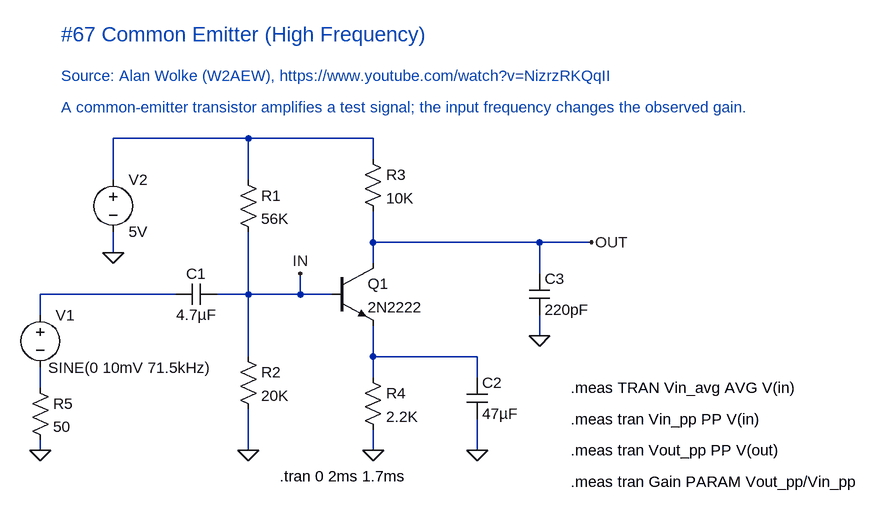
[diagram p0: schematic Common Emitter High Frequency).asc]
Common Emitter High Frequency).asc, the LTspice schematic file:
Version 4.1
SHEET 1 1400 680
WIRE 144 -144 -64 -144
WIRE 336 -144 144 -144
WIRE 336 -112 336 -144
WIRE -64 -80 -64 -144
WIRE 144 -80 144 -144
WIRE 336 16 336 -32
WIRE 592 16 336 16
WIRE 672 16 592 16
WIRE -64 32 -64 0
WIRE 336 48 336 16
WIRE 592 64 592 16
WIRE 32 96 -176 96
WIRE 144 96 144 0
WIRE 144 96 96 96
WIRE 224 96 224 64
WIRE 224 96 144 96
WIRE 272 96 224 96
WIRE -176 128 -176 96
WIRE 592 160 592 128
WIRE 144 192 144 96
WIRE 336 192 336 144
WIRE 496 192 336 192
WIRE 336 224 336 192
WIRE 496 224 496 192
WIRE -176 240 -176 208
WIRE -176 336 -176 320
WIRE 144 336 144 272
WIRE 336 336 336 304
WIRE 496 336 496 288
FLAG 144 336 0
FLAG 336 336 0
FLAG 496 336 0
FLAG 592 160 0
FLAG -64 32 0
FLAG 672 16 OUT
FLAG -176 336 0
FLAG 224 64 IN
SYMBOL cap 96 80 R90
WINDOW 0 0 32 VBottom 2
WINDOW 3 32 32 VTop 2
SYMATTR InstName C1
SYMATTR Value 4.7µF
SYMBOL res 128 -96 R0
SYMATTR InstName R1
SYMATTR Value 56K
SYMBOL res 128 176 R0
SYMATTR InstName R2
SYMATTR Value 20K
SYMBOL npn 272 48 R0
SYMATTR InstName Q1
SYMATTR Value 2N2222
SYMBOL res 320 -128 R0
SYMATTR InstName R3
SYMATTR Value 10K
SYMBOL res 320 208 R0
SYMATTR InstName R4
SYMATTR Value 2.2K
SYMBOL cap 480 224 R0
SYMATTR InstName C2
SYMATTR Value 47µF
SYMBOL cap 576 64 R0
SYMATTR InstName C3
SYMATTR Value 220pF
SYMBOL voltage -64 -96 R0
WINDOW 123 0 0 Left 0
WINDOW 39 0 0 Left 0
SYMATTR InstName V2
SYMATTR Value 5V
SYMBOL voltage -176 112 R0
WINDOW 3 12 97 Left 2
WINDOW 123 0 0 Left 0
WINDOW 39 0 0 Left 0
SYMATTR Value SINE(0 10mV 71.5kHz)
SYMATTR InstName V1
SYMBOL res -192 224 R0
SYMATTR InstName R5
SYMATTR Value 50
TEXT 192 376 Left 2 !.tran 0 2ms 1.7ms
TEXT 640 240 Left 2 !.meas TRAN Vin_avg AVG V(in)
TEXT 640 288 Left 2 !.meas tran Vin_pp PP V(in)
TEXT 640 336 Left 2 !.meas tran Vout_pp PP V(out)
TEXT 640 384 Left 2 !.meas tran Gain PARAM Vout_pp/Vin_pp
TEXT -144 -304 Left 3 ;#67 Common Emitter (High Frequency)
TEXT -144 -240 Left 2 ;Source: Alan Wolke (W2AEW), https://www.youtube.com/watch?v=NizrzRKQqII
TEXT -144 -192 Left 2 ;A common-emitter transistor amplifies a test signal; the input frequency changes the observed gain.

The netlist it stands for:
* Common Emitter High Frequency).asc
C1 IN N002 4.7µF
R1 N001 IN 56K
R2 IN 0 20K
Q1 OUT IN N003 0 2N2222
R3 N001 OUT 10K
R4 N003 0 2.2K
C2 N003 0 47µF
C3 OUT 0 220pF
V2 N001 0 5V
V1 N002 N004 SINE(0 10mV 71.5kHz)
R5 N004 0 50
.model NPN NPN
.model PNP PNP
.lib standard.bjt
.tran 0 2ms 1.7ms
.meas TRAN Vin_avg AVG V(in)
.meas tran Vin_pp PP V(in)
.meas tran Vout_pp PP V(out)
.meas tran Gain PARAM Vout_pp/Vin_pp
* #67 Common Emitter (High Frequency)
* Source: Alan Wolke (W2AEW), https://www.youtube.com/watch?v=NizrzRKQqII
* A common-emitter transistor amplifies a test signal; the input frequency changes the observed gain.
.backanno
.end